# Altium project Main_Board.PrjPcb (part 32 of 44)

## Sheet GPIO_I2C.SchDoc: GPIO - EXPANDER
size A3; Organization: Altium Limited; Address1: L3, 12a Rodborough Rd; Address2: Frenchs Forest; Address3: NSW; Address4: Australia 2086
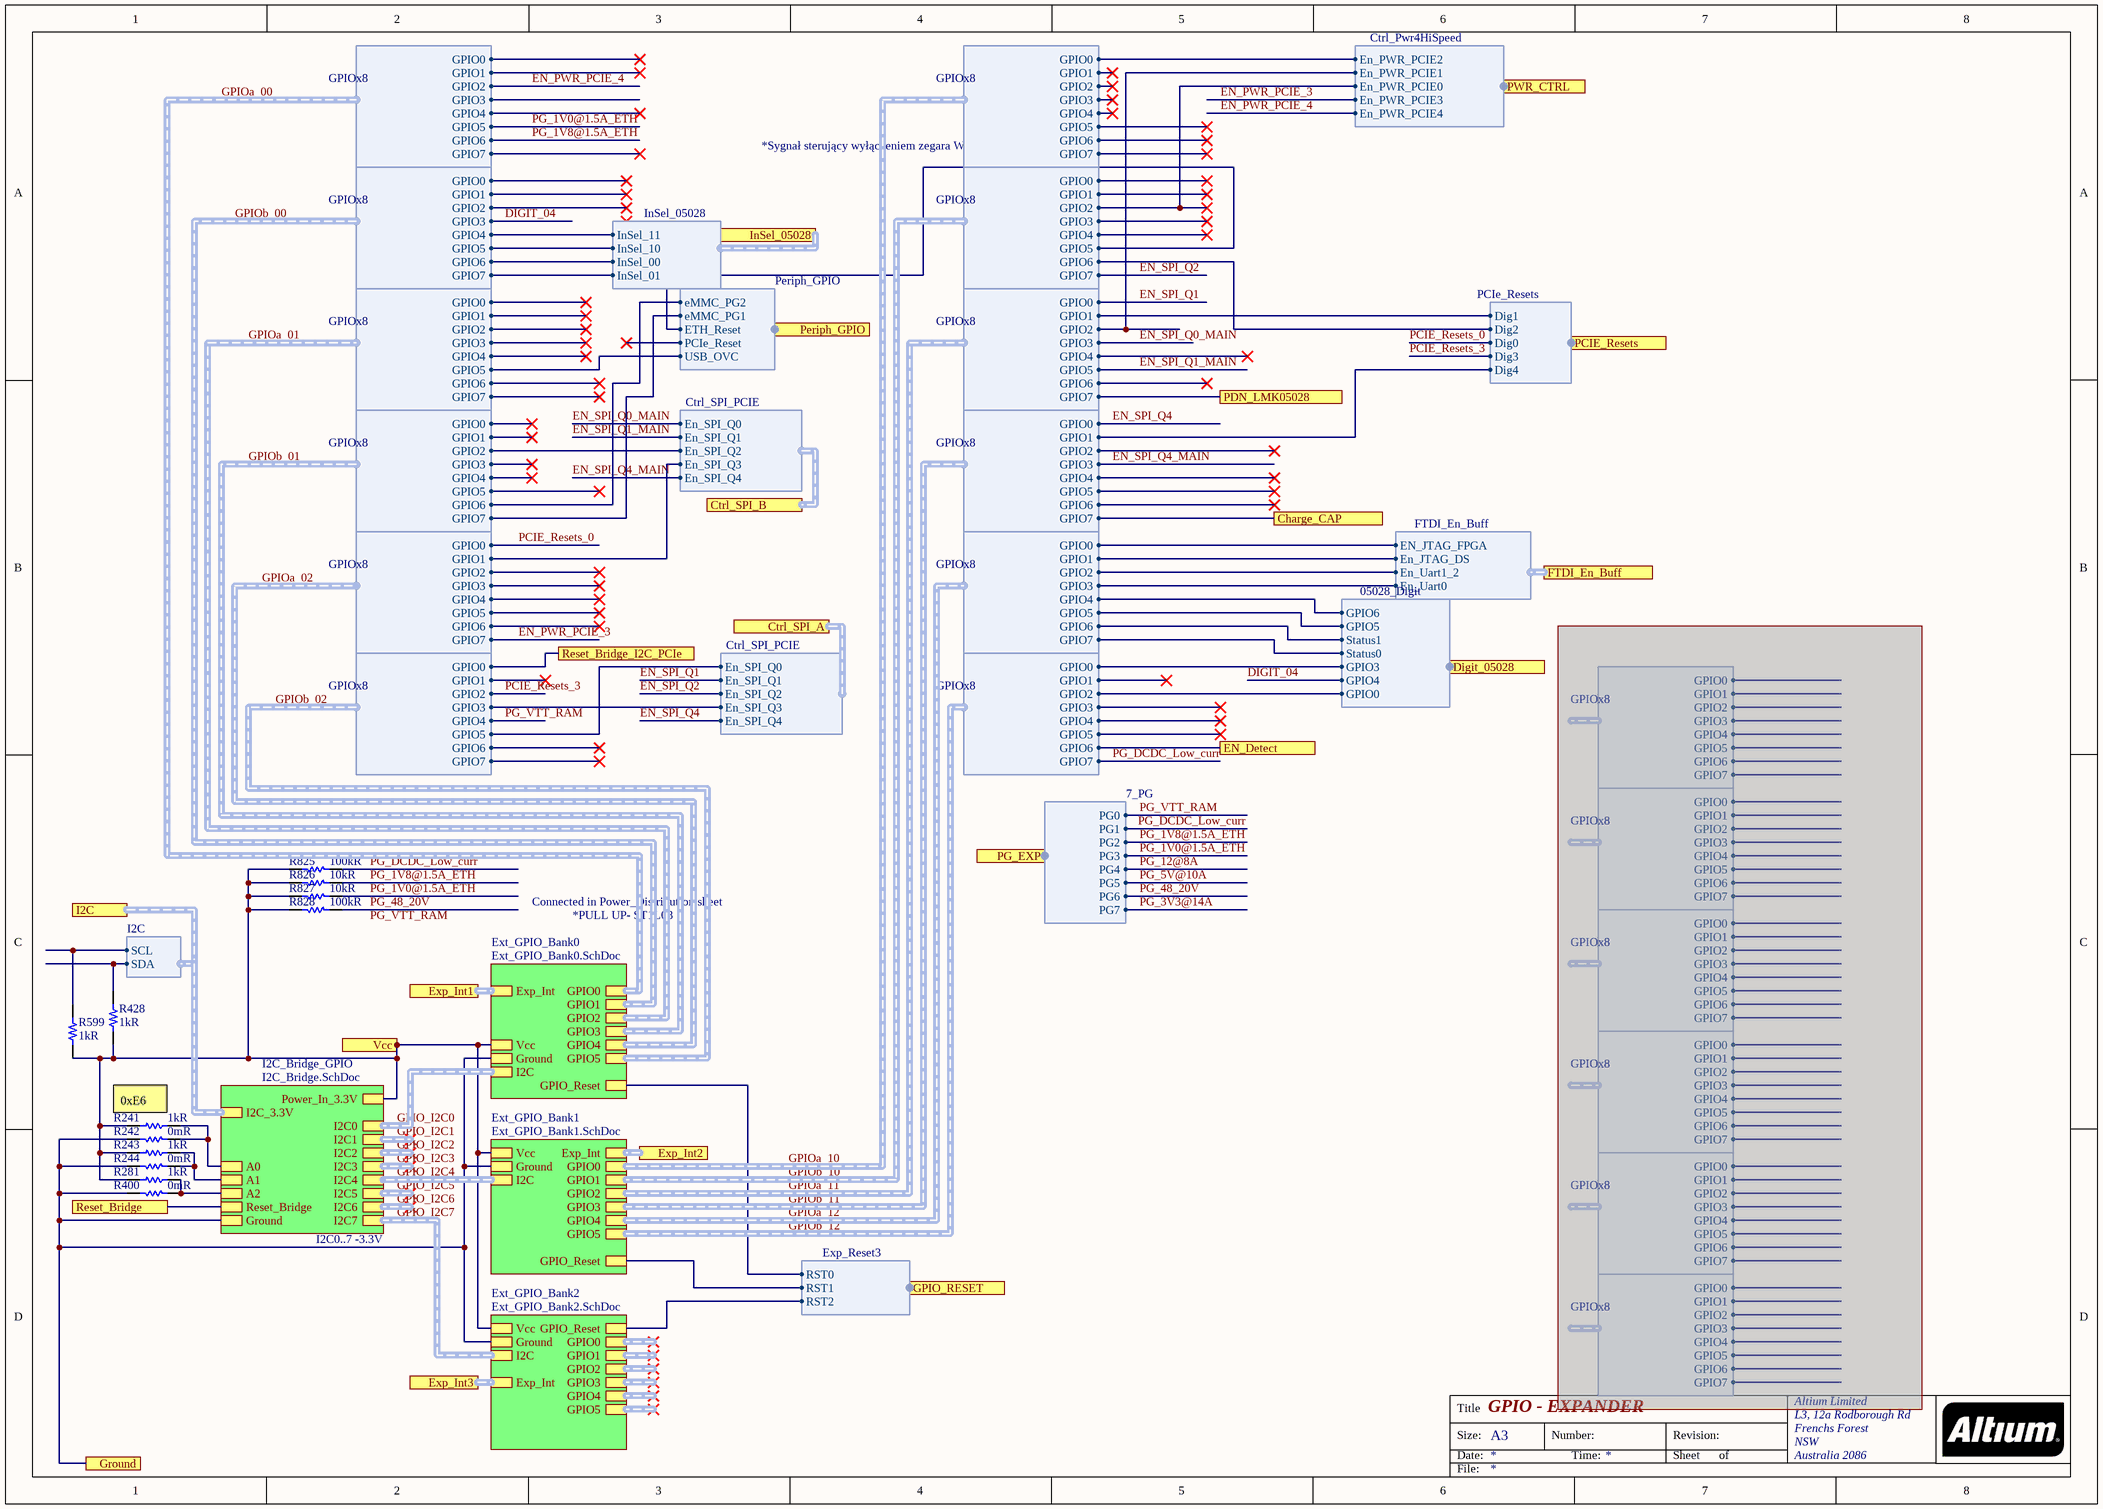
[diagram p47: GPIO_I2C.SchDoc]

### Parts
R241  1kR  [RES 0402/1005 RF KK]
R242  0mR  [RES 0402/1005 RF KK]
R243  1kR  [RES 0402/1005 RF KK]
R244  0mR  [RES 0402/1005 RF KK]
R281  1kR  [RES 0402/1005 RF KK]
R400  0mR  [RES 0402/1005 RF KK]
R428  1kR  [RES 0402/1005 RF KK]
R599  1kR  [RES 0402/1005 RF KK]
R825  100kR  [RES 0402/1005 RF KK]
R826  10kR  [RES 0402/1005 RF KK]
R827  10kR  [RES 0402/1005 RF KK]
R828  100kR  [RES 0402/1005 RF KK]

### Sub-sheets
Ext_GPIO_Bank0 = Ext_GPIO_Bank0.SchDoc: Vcc, Ground, I2C (harness I2C), GPIO5 (harness GPIOx8), GPIO4 (harness GPIOx8), GPIO3 (harness GPIOx8), GPIO2 (harness GPIOx8), GPIO1 (harness GPIOx8), GPIO0 (harness GPIOx8), GPIO_Reset, Exp_Int (harness Exp_Int)
Ext_GPIO_Bank1 = Ext_GPIO_Bank1.SchDoc: Vcc, Ground, I2C (harness I2C), GPIO5 (harness GPIOx8), GPIO4 (harness GPIOx8), GPIO3 (harness GPIOx8), GPIO2 (harness GPIOx8), GPIO1 (harness GPIOx8), GPIO0 (harness GPIOx8), GPIO_Reset, Exp_Int (harness Exp_Int)
Ext_GPIO_Bank2 = Ext_GPIO_Bank2.SchDoc: Vcc, Ground, I2C (harness I2C), GPIO5 (harness GPIOx8), GPIO4 (harness GPIOx8), GPIO3 (harness GPIOx8), GPIO2 (harness GPIOx8), GPIO1 (harness GPIOx8), GPIO0 (harness GPIOx8), GPIO_Reset, Exp_Int (harness Exp_Int)
I2C_Bridge_GPIO = I2C_Bridge.SchDoc: I2C0 (harness I2C), I2C1 (harness I2C), I2C2 (harness I2C), I2C3 (harness I2C), I2C4 (harness I2C), I2C5 (harness I2C), I2C6 (harness I2C), I2C7 (harness I2C), Ground, A2, A1, A0, I2C_3.3V (harness I2C), Reset_Bridge, Power_In_3.3V

### Ports
Charge_CAP, Ctrl_SPI_A (harness Ctrl_SPI_PCIE), Ctrl_SPI_B (harness Ctrl_SPI_PCIE), Digit_05028 (harness 05028_Digit), EN_Detect, Exp_Int1 (harness Exp_Int), Exp_Int2 (harness Exp_Int), Exp_Int3 (harness Exp_Int), FTDI_En_Buff (harness FTDI_En_Buff), GPIO_RESET (harness Exp_Reset3), Ground, I2C (harness I2C), InSel_05028 (harness InSel_05028), PCIE_Resets (harness PCIe_Resets), PDN_LMK05028, Periph_GPIO (harness Periph_GPIO), PG_EXP (harness 7_PG), PWR_CTRL (harness Ctrl_Pwr4HiSpeed), Reset_Bridge, Reset_Bridge_I2C_PCIe, Vcc

### Harnesses
Ctrl_SPI_PCIE: En_SPI_Q0, En_SPI_Q1, En_SPI_Q2, En_SPI_Q3, En_SPI_Q4
I2C: SCL, SDA
7_PG: PG0, PG1, PG2, PG3, PG4, PG5, PG6, PG7
GPIOx8: GPIO0, GPIO1, GPIO2, GPIO3, GPIO4, GPIO5, GPIO6, GPIO7
PCIe_Resets: Dig0, Dig1, Dig2, Dig3, Dig4
Ctrl_Pwr4HiSpeed: En_PWR_PCIE0, En_PWR_PCIE1, En_PWR_PCIE2, En_PWR_PCIE3, En_PWR_PCIE4
Exp_Reset3: RST0, RST1, RST2
InSel_05028: InSel_00, InSel_01, InSel_10, InSel_11
FTDI_En_Buff: EN_JTAG_FPGA, En_JTAG_DS, En_Uart1_2, En_Uart0
Periph_GPIO: eMMC_PG2, eMMC_PG1, ETH_Reset, PCIe_Reset, USB_OVC
05028_Digit: GPIO4, GPIO3, Status0, GPIO6, Status1, GPIO5, GPIO0

### Nets
B503_Ground: R242.2 R244.2 R400.2 ; port Ground, sheet I2C_Bridge_GPIO/Ground, sheet Ext_GPIO_Bank0/Ground, sheet Ext_GPIO_Bank1/Ground, sheet Ext_GPIO_Bank2/Ground
3V3_RAIL: R241.1 R243.1 R281.1 R428.2 R599.2 R825.1 R826.1 R827.1 R828.1 ; port Vcc, sheet I2C_Bridge_GPIO/Power_In_3.3V, sheet Ext_GPIO_Bank0/Vcc, sheet Ext_GPIO_Bank1/Vcc, sheet Ext_GPIO_Bank2/Vcc
Charge_CAP: port Charge_CAP, sheet Ext_GPIO_Bank1/GPIO3.GPIO7
D_05028_G3: sheet Ext_GPIO_Bank1/GPIO5.GPIO0, port Digit_05028.GPIO3
D_05028_G5: sheet Ext_GPIO_Bank1/GPIO4.GPIO5, port Digit_05028.GPIO5
D_05028_G6: sheet Ext_GPIO_Bank1/GPIO4.GPIO4, port Digit_05028.GPIO6
D_05028_S0: sheet Ext_GPIO_Bank1/GPIO4.GPIO7, port Digit_05028.Status0
D_05028_S1: sheet Ext_GPIO_Bank1/GPIO4.GPIO6, port Digit_05028.Status1
DIGIT_04: sheet Ext_GPIO_Bank0/GPIO1.GPIO3, port Digit_05028.GPIO4  [project net D_05028_G4]
eMMC_PG1: sheet Ext_GPIO_Bank0/GPIO3.GPIO7, port Periph_GPIO.eMMC_PG1
eMMC_PG2: sheet Ext_GPIO_Bank0/GPIO3.GPIO6, port Periph_GPIO.eMMC_PG2
EN_Detect: port EN_Detect, sheet Ext_GPIO_Bank1/GPIO5.GPIO6
EN_PWR_PCIE_3: sheet Ext_GPIO_Bank0/GPIO4.GPIO7, port PWR_CTRL.En_PWR_PCIE3
EN_PWR_PCIE_4: sheet Ext_GPIO_Bank0/GPIO0.GPIO2, port PWR_CTRL.En_PWR_PCIE4
En_PWRSwitch_PCIE0: sheet Ext_GPIO_Bank1/GPIO1.GPIO2, port PWR_CTRL.En_PWR_PCIE0
En_PWRSwitch_PCIE1: sheet Ext_GPIO_Bank1/GPIO2.GPIO2, port PWR_CTRL.En_PWR_PCIE1
En_PWRSwitch_PCIE2: sheet Ext_GPIO_Bank1/GPIO0.GPIO0, port PWR_CTRL.En_PWR_PCIE2
EN_SPI_Q0_MAIN: port Ctrl_SPI_B.En_SPI_Q0, sheet Ext_GPIO_Bank1/GPIO2.GPIO3
EN_SPI_Q1: port Ctrl_SPI_A.En_SPI_Q1, sheet Ext_GPIO_Bank1/GPIO2.GPIO0
EN_SPI_Q1_MAIN: port Ctrl_SPI_B.En_SPI_Q1, sheet Ext_GPIO_Bank1/GPIO2.GPIO5
EN_SPI_Q2: port Ctrl_SPI_A.En_SPI_Q2, sheet Ext_GPIO_Bank1/GPIO1.GPIO7
EN_SPI_Q4: port Ctrl_SPI_A.En_SPI_Q4, sheet Ext_GPIO_Bank1/GPIO3.GPIO0
EN_SPI_Q4_MAIN: port Ctrl_SPI_B.En_SPI_Q4, sheet Ext_GPIO_Bank1/GPIO3.GPIO3
FTDI_JTAG_ON_1: sheet Ext_GPIO_Bank1/GPIO4.GPIO0, port FTDI_En_Buff.EN_JTAG_FPGA
FTDI_JTAG_ON_2: sheet Ext_GPIO_Bank1/GPIO4.GPIO1, port FTDI_En_Buff.En_JTAG_DS
FTDI_JTAG_ON_3: sheet Ext_GPIO_Bank1/GPIO4.GPIO2, port FTDI_En_Buff.En_Uart1_2
FTDI_JTAG_ON_4: sheet Ext_GPIO_Bank1/GPIO4.GPIO3, port FTDI_En_Buff.En_Uart0
GPIO_ETH_EXPANDER: sheet Ext_GPIO_Bank1/GPIO1.GPIO5, port Periph_GPIO.ETH_Reset
GPIO_Exp_Reset0: sheet Ext_GPIO_Bank0/GPIO_Reset, port GPIO_RESET.RST0
GPIO_Exp_Reset1: sheet Ext_GPIO_Bank1/GPIO_Reset, port GPIO_RESET.RST1
GPIO_Exp_Reset2: sheet Ext_GPIO_Bank2/GPIO_Reset, port GPIO_RESET.RST2
GPIOa_01.GPIO5: sheet Ext_GPIO_Bank0/GPIO2.GPIO5, port Periph_GPIO.USB_OVC
GPIOa_02.GPIO1: port Ctrl_SPI_B.En_SPI_Q3, sheet Ext_GPIO_Bank0/GPIO4.GPIO1
GPIOa_11.GPIO1: sheet Ext_GPIO_Bank1/GPIO2.GPIO1, port PCIE_Resets.Dig1
GPIOa_11.GPIO7: port PDN_LMK05028, sheet Ext_GPIO_Bank1/GPIO2.GPIO7
GPIOb_00.GPIO4: sheet Ext_GPIO_Bank0/GPIO1.GPIO4, port InSel_05028.InSel_11
GPIOb_00.GPIO5: sheet Ext_GPIO_Bank0/GPIO1.GPIO5, port InSel_05028.InSel_10
GPIOb_00.GPIO6: sheet Ext_GPIO_Bank0/GPIO1.GPIO6, port InSel_05028.InSel_00
GPIOb_00.GPIO7: sheet Ext_GPIO_Bank0/GPIO1.GPIO7, port InSel_05028.InSel_01
GPIOb_01.GPIO2: port Ctrl_SPI_B.En_SPI_Q2, sheet Ext_GPIO_Bank0/GPIO3.GPIO2
GPIOb_02.GPIO0: port Reset_Bridge_I2C_PCIe, sheet Ext_GPIO_Bank0/GPIO5.GPIO0
GPIOb_02.GPIO3: port Ctrl_SPI_A.En_SPI_Q3, sheet Ext_GPIO_Bank0/GPIO5.GPIO3
GPIOb_02.GPIO5: port Ctrl_SPI_A.En_SPI_Q0, sheet Ext_GPIO_Bank0/GPIO5.GPIO5
GPIOb_10.GPIO6: sheet Ext_GPIO_Bank1/GPIO1.GPIO6, port PCIE_Resets.Dig2
GPIOb_11.GPIO1: sheet Ext_GPIO_Bank1/GPIO3.GPIO1, port PCIE_Resets.Dig4
GPIOb_12.GPIO2: sheet Ext_GPIO_Bank1/GPIO5.GPIO2, port Digit_05028.GPIO0
I2C1_Rail.SCL: R599.1 ; port I2C.SCL
I2C1_Rail.SDA: R428.1 ; port I2C.SDA
PCIE_Resets_0: sheet Ext_GPIO_Bank0/GPIO4.GPIO0, port PCIE_Resets.Dig0  [project net GPIOa_02.GPIO0]
PCIE_Resets_3: sheet Ext_GPIO_Bank0/GPIO5.GPIO2, port PCIE_Resets.Dig3  [project net GPIOb_02.GPIO2]
PG_1V0@1.5A_ETH: R827.2 ; port PG_EXP.PG3, sheet Ext_GPIO_Bank0/GPIO0.GPIO5  [project net GPIOa_00.GPIO5]
PG_1V8@1.5A_ETH: R826.2 ; port PG_EXP.PG2, sheet Ext_GPIO_Bank0/GPIO0.GPIO6  [project net GPIOa_00.GPIO6]
PG_48_20V: R828.2 ; port PG_EXP.PG6
PG_DCDC_Low_curr: R825.2 ; port PG_EXP.PG1, sheet Ext_GPIO_Bank1/GPIO5.GPIO7  [project net GPIOb_12.GPIO7]
PG_VTT_RAM: port PG_EXP.PG0, sheet Ext_GPIO_Bank0/GPIO5.GPIO4  [project net GPIOb_02.GPIO4]
NetR241_2: R241.2 R242.1 ; sheet I2C_Bridge_GPIO/A0
NetR243_2: R243.2 R244.1 ; sheet I2C_Bridge_GPIO/A1
NetR281_2: R281.2 R400.1 ; sheet I2C_Bridge_GPIO/A2
NetSP12_I2C_Bridge_GPIO_1: port Reset_Bridge, sheet I2C_Bridge_GPIO/Reset_Bridge

### Buses and harness runs
harness GPIO_I2C0 = sheet Ext_GPIO_Bank0/I2C = sheet I2C_Bridge_GPIO/I2C0
harness GPIO_I2C1 = sheet I2C_Bridge_GPIO/I2C1
harness GPIO_I2C2 = sheet I2C_Bridge_GPIO/I2C2
harness GPIO_I2C3 = sheet I2C_Bridge_GPIO/I2C3
harness GPIO_I2C4 = sheet Ext_GPIO_Bank1/I2C = sheet I2C_Bridge_GPIO/I2C4
harness GPIO_I2C5 = sheet I2C_Bridge_GPIO/I2C5
harness GPIO_I2C6 = sheet I2C_Bridge_GPIO/I2C6
harness GPIO_I2C7 = sheet Ext_GPIO_Bank2/I2C = sheet I2C_Bridge_GPIO/I2C7
harness GPIOa_00 = sheet Ext_GPIO_Bank0/GPIO0
harness GPIOa_01 = sheet Ext_GPIO_Bank0/GPIO2
harness GPIOa_02 = sheet Ext_GPIO_Bank0/GPIO4
harness GPIOa_10 = sheet Ext_GPIO_Bank1/GPIO0
harness GPIOa_11 = sheet Ext_GPIO_Bank1/GPIO2
harness GPIOa_12 = sheet Ext_GPIO_Bank1/GPIO4
harness GPIOb_00 = sheet Ext_GPIO_Bank0/GPIO1
harness GPIOb_01 = sheet Ext_GPIO_Bank0/GPIO3
harness GPIOb_02 = sheet Ext_GPIO_Bank0/GPIO5
harness GPIOb_10 = sheet Ext_GPIO_Bank1/GPIO1
harness GPIOb_11 = sheet Ext_GPIO_Bank1/GPIO3
harness GPIOb_12 = sheet Ext_GPIO_Bank1/GPIO5
harness port Exp_Int1 = sheet Ext_GPIO_Bank0/Exp_Int
harness port Exp_Int2 = sheet Ext_GPIO_Bank1/Exp_Int
harness port Exp_Int3 = sheet Ext_GPIO_Bank2/Exp_Int
harness port I2C = sheet I2C_Bridge_GPIO/I2C_3.3V

### Notes on the sheet
- *Sygnał sterujący wyłączeniem zegara WR
- Connected in Power_Distribution sheet
- *PULL UP- ST1L08
- (near R241) 0xE6
- I2C0..7 -3.3V
- Labels drawn without touching a wire or pin: PG_VTT_RAM
- Title
- Size:
- Date:
- A3
- Number:
- Time:
- Revision:
- Sheet
- of
- File:

### Library data of the parts
R241 R243 R281 = Resistor: PANASONIC - ERJ-2RKF1001X - SMD Chip Resistor, 0402 [1005 Metric], 1 kohm, ERJ2R Series, 50 V, Thick Film, 100 mW; Voltage Rating (DC): 50V; Temperature Coefficient: 100ppm/°C; Tolerance: 1%; Power Rating: 100mW; Supplier 1: Digi-Key; Supplier Part Number 1: P1.00KLDKR-ND; Manufacturer: Panasonic; Manufacturer Part Number: ERJ-2RKF1001X; RoHS: Yes; Category: Chip SMD Resistors; Stock 1: 1864188; Pricing 1: 1=0,10000, 10=0,04300, 100=0,01740, 1000=0,00782, 2500=0,00678, 5000=0,00561 (USD); Mount: Surface Mount; Case/Package: 0402; Number of Pins: 2; Case Code (Imperial): 0402; Case Code (Metric): 1005; Contact Plating: Tin; Min Operating Temperature: -55°C; Max Operating Temperature: 155°C; Termination: SMD/SMT; Composition: Thick Film; Number of Terminations: 2; Military Standard: Not; Features: Automotive AEC-Q200; Resistance: 1kR; Packaging: Tape and Reel; Voltage Rating: 50V; Package Quantity: 1; Max Power Dissipation: 100mW; Working Voltage: 50V; Length: 1mm; Height: 0.35mm; Depth: 0.5mm; Width: 0.5mm; Radiation Hardening: No; Lead Free: Lead Free; REACH SVHC: No SVHC; ComponentLink1URL: https://datasheet.ciiva.com/11821/0900766b80f80784-11821203.pdf?src-supplier=RSComponents; ComponentLink1Description: https://datasheet.ciiva.com/11821/0900766b80f80784-11821203.pdf?src-supplier=RSComponents; ComponentLink2URL: https://datasheet.ciiva.com/7942/aoa0000ce2-7942426.pdf?src-supplier=Element14; ComponentLink2Description: https://datasheet.ciiva.com/7942/aoa0000ce2-7942426.pdf?src-supplier=Element14; ComponentLink3URL: https://datasheet.ciiva.com/16523/aoa0000ce2-16523834.pdf?src-supplier=Avnet+Asia; ComponentLink3Description: https://datasheet.ciiva.com/16523/aoa0000ce2-16523834.pdf?src-supplier=Avnet+Asia; ComponentLink4URL: https://datasheet.ciiva.com/17215/aoa0000ce2-17215308.pdf?src-supplier=Avnet+Europe; ComponentLink4Description: https://datasheet.ciiva.com/17215/aoa0000ce2-17215308.pdf?src-supplier=Avnet+Europe; ComponentLink5URL: https://datasheet.ciiva.com/22673/1678782-22673916.pdf?src-supplier=Element14; ComponentLink5Description: https://datasheet.ciiva.com/22673/1678782-22673916.pdf?src-supplier=Element14; ComponentLink6URL: https://datasheet.ciiva.com/28532/1678782-28532109.pdf?src-supplier=Element14; ComponentLink6Description: https://datasheet.ciiva.com/28532/1678782-28532109.pdf?src-supplier=Element14; ComponentLink7URL: https://datasheet.ciiva.com/16767/70260748-16767559.pdf?src-supplier=Allied+Electronics; ComponentLink7Description: https://datasheet.ciiva.com/16767/70260748-16767559.pdf?src-supplier=Allied+Electronics; ComponentLink8URL: https://datasheet.ciiva.com/9198/aoa0000ce2-9198920.pdf?src-supplier=Avnet; ComponentLink8Description: https://datasheet.ciiva.com/9198/aoa0000ce2-9198920.pdf?src-supplier=Avnet; ComponentLink9URL: https://datasheet.ciiva.com/16771/70260748-16771979.pdf?src-supplier=Allied+Electronics; ComponentLink9Description: https://datasheet.ciiva.com/16771/70260748-16771979.pdf?src-supplier=Allied+Electronics
R242 R244 R400 = Resistor: as R665 on sheet Power_48_20V@3A; Supplier 1: Digi-Key; Supplier Part Number 1: 311-0.0JRCT-ND; Stock 1: 69822252; Pricing 1: 1=0.10000, 10=0.01200, 25=0.00920, 50=0.00680, 100=0.00510, 250=0.00388, 500=0.00308, 1000=0.00227, 5000=0.00163 (USD); RoHS: Yes; Case/Package: 0402; Contact Plating: Tin,Matte; Case Code (Metric): 1005; Case Code (Imperial): 0402; Min Operating Temperature: -55°C; Max Operating Temperature: 155°C; Resistance: 0mR; Packaging: Tape and Reel; Composition: Thick Film; Package Quantity: 1; Number of Terminations: 2; Termination: SMD/SMT; Military Standard: Not; Features: Moisture Resistant; Length: 1mm; Height: 0.016inch; Width: 0.02inch; Depth: 0.5mm; Radiation Hardening: No; REACH SVHC: Unknown; Lead Free: Lead Free; ComponentLink1URL: https://datasheet.ciiva.com/2452/pyu-rc0402-51-rohs-l-6-2452608.pdf?src-supplier=Digi-Key; ComponentLink1Description: https://datasheet.ciiva.com/2452/pyu-rc0402-51-rohs-l-6-2452608.pdf?src-supplier=Digi-Key; ComponentLink2URL: https://datasheet.ciiva.com/11808/0900766b80c66297-11808195.pdf?src-supplier=RSComponents; ComponentLink2Description: https://datasheet.ciiva.com/11808/0900766b80c66297-11808195.pdf?src-supplier=RSComponents; ComponentLink3URL: https://datasheet.ciiva.com/2452/pyu-r-int-thick-7-2452609.pdf?src-supplier=Digi-Key; ComponentLink3Description: https://datasheet.ciiva.com/2452/pyu-r-int-thick-7-2452609.pdf?src-supplier=Digi-Key; ComponentLink4URL: https://datasheet.ciiva.com/22747/1018594-22747515.pdf?src-supplier=Element14; ComponentLink4Description: https://datasheet.ciiva.com/22747/1018594-22747515.pdf?src-supplier=Element14; ComponentLink5URL: https://datasheet.ciiva.com/7983/1018594-7983535.pdf?src-supplier=Element14; ComponentLink5Description: https://datasheet.ciiva.com/7983/1018594-7983535.pdf?src-supplier=Element14; ComponentLink6URL: https://datasheet.ciiva.com/2452/pyu-r-int-thick-7-2452610.pdf?src-supplier=Digi-Key; ComponentLink6Description: https://datasheet.ciiva.com/2452/pyu-r-int-thick-7-2452610.pdf?src-supplier=Digi-Key; ComponentLink7URL: https://datasheet.ciiva.com/8896/pyu-rc0402-51-rohs-l-6-8896201.pdf?src-supplier=Avnet; ComponentLink7Description: https://datasheet.ciiva.com/8896/pyu-rc0402-51-rohs-l-6-8896201.pdf?src-supplier=Avnet; ComponentLink8URL: https://datasheet.ciiva.com/28386/pyu-rc0402-51-rohs-l-6-28386633.pdf?src-supplier=Avnet+Europe; ComponentLink8Description: https://datasheet.ciiva.com/28386/pyu-rc0402-51-rohs-l-6-28386633.pdf?src-supplier=Avnet+Europe; ComponentLink9URL: https://datasheet.ciiva.com/15189/getdatasheetpartid-326379-15189533.pdf?src-supplier=Verical; ComponentLink9Description: https://datasheet.ciiva.com/15189/getdatasheetpartid-326379-15189533.pdf?src-supplier=Verical
R428 R599 = Resistor: Manufacturer: Panasonic; Manufacturer Part Number: ERJ-2RKF1001X; Tolerance: 1%; Power Rating: 100mW; Temperature Coefficient: 100ppm/°C; Voltage Rating: 50V; Supplier 1: Digi-Key; Supplier Part Number 1: P1.00KLCT-ND; Stock 1: 6683975; Pricing 1: 1 = 0,10000, 10 = 0,05200, 100 = 0,02130, 1000 = 0,00958, 2500 = 0,00832, 5000 = 0,00687 (USD); RoHS: Yes; Mount: Surface Mount; Case/Package: 0402; Number of Pins: 2; Case Code (Imperial): 0402; Case Code (Metric): 1005; Contact Plating: Tin; Min Operating Temperature: -55°C; Max Operating Temperature: 155°C; Resistance: 1kR; Packaging: Tape and Reel; Composition: Thick Film; Termination: SMD/SMT; Package Quantity: 1; Military Standard: Not; Number of Terminations: 2; Max Power Dissipation: 100mW; Voltage Rating (DC): 50V; Features: Automotive AEC-Q200; Working Voltage: 50V; Length: 1mm; Height: 0.35mm; Width: 0.5mm; Depth: 0.5mm; Radiation Hardening: No; Lead Free: Lead Free; REACH SVHC: No SVHC; ComponentLink1URL: https://datasheet.ciiva.com/11821/0900766b80f80784-11821203.pdf?src-supplier=RSComponents; ComponentLink1Description: https://datasheet.ciiva.com/11821/0900766b80f80784-11821203.pdf?src-supplier=RSComponents; ComponentLink2URL: https://datasheet.ciiva.com/16767/70260748-16767559.pdf?src-supplier=Allied+Electronics; ComponentLink2Description: https://datasheet.ciiva.com/16767/70260748-16767559.pdf?src-supplier=Allied+Electronics; ComponentLink3URL: https://datasheet.ciiva.com/9198/aoa0000ce2-9198920.pdf?src-supplier=Avnet; ComponentLink3Description: https://datasheet.ciiva.com/9198/aoa0000ce2-9198920.pdf?src-supplier=Avnet; ComponentLink4URL: https://datasheet.ciiva.com/7942/aoa0000ce2-7942426.pdf?src-supplier=Element14; ComponentLink4Description: https://datasheet.ciiva.com/7942/aoa0000ce2-7942426.pdf?src-supplier=Element14; ComponentLink5URL: https://datasheet.ciiva.com/16771/70260748-16771979.pdf?src-supplier=Allied+Electronics; ComponentLink5Description: https://datasheet.ciiva.com/16771/70260748-16771979.pdf?src-supplier=Allied+Electronics; ComponentLink6URL: https://datasheet.ciiva.com/17215/aoa0000ce2-17215308.pdf?src-supplier=Avnet+Europe; ComponentLink6Description: https://datasheet.ciiva.com/17215/aoa0000ce2-17215308.pdf?src-supplier=Avnet+Europe; ComponentLink7URL: https://datasheet.ciiva.com/28532/1678782-28532109.pdf?src-supplier=Element14; ComponentLink7Description: https://datasheet.ciiva.com/28532/1678782-28532109.pdf?src-supplier=Element14; ComponentLink8URL: https://datasheet.ciiva.com/16523/aoa0000ce2-16523834.pdf?src-supplier=Avnet+Asia; ComponentLink8Description: https://datasheet.ciiva.com/16523/aoa0000ce2-16523834.pdf?src-supplier=Avnet+Asia; ComponentLink9URL: https://datasheet.ciiva.com/22673/1678782-22673916.pdf?src-supplier=Element14; ComponentLink9Description: https://datasheet.ciiva.com/22673/1678782-22673916.pdf?src-supplier=Element14
R825 R828 = Resistor: as R646 on sheet ADP1741_3V3_0V85; Supplier 1: Digi-Key; Supplier Part Number 1: P100KDECT-ND; Stock 1: 54338; Pricing 1: 1=0.22000, 10=0.18800, 100=0.07350, 1000=0.03077, 2500=0.02820, 5000=0.02564 (USD); RoHS: Yes; Mount: Surface Mount; Case/Package: 0402; Case Code (Imperial): 0402; Case Code (Metric): 1005; Contact Plating: Tin; Min Operating Temperature: -55°C; Max Operating Temperature: 155°C; Resistance: 100kR; Packaging: Tape and Reel; Package Quantity: 10000; Composition: Metal Film,Thin Film; Number of Terminations: 2; Military Standard: Not; Termination: SMD/SMT; Max Power Dissipation: 63mW; Voltage Rating (DC): 25V; Length: 1mm; Height: 0.016inch; Width: 0.5mm; Depth: 0.5mm; Radiation Hardening: No; REACH SVHC: No SVHC; Lead Free: Lead Free; ComponentLink1URL: https://datasheet.ciiva.com/24028/aoa0000ce26-197354-24028150.pdf?src-supplier=Mouser; ComponentLink1Description: https://datasheet.ciiva.com/24028/aoa0000ce26-197354-24028150.pdf?src-supplier=Mouser; ComponentLink2URL: https://datasheet.ciiva.com/43470/1776116-43470438.pdf?src-supplier=Farnell; ComponentLink2Description: https://datasheet.ciiva.com/43470/1776116-43470438.pdf?src-supplier=Farnell; ComponentLink3URL: https://datasheet.ciiva.com/7830/1776116-7830920.pdf?src-supplier=Element14; ComponentLink3Description: https://datasheet.ciiva.com/7830/1776116-7830920.pdf?src-supplier=Element14; ComponentLink4URL: https://datasheet.ciiva.com/46378/1776116-46378234.pdf?src-supplier=Element14; ComponentLink4Description: https://datasheet.ciiva.com/46378/1776116-46378234.pdf?src-supplier=Element14; ComponentLink5URL: https://datasheet.ciiva.com/16780/70068849-16780139.pdf?src-supplier=Allied+Electronics; ComponentLink5Description: https://datasheet.ciiva.com/16780/70068849-16780139.pdf?src-supplier=Allied+Electronics; ComponentLink6URL: https://datasheet.ciiva.com/9117/aoa0000ce26-9117229.pdf?src-supplier=Avnet; ComponentLink6Description: https://datasheet.ciiva.com/9117/aoa0000ce26-9117229.pdf?src-supplier=Avnet; ComponentLink7URL: https://datasheet.ciiva.com/16511/aoa0000ce26-16511566.pdf?src-supplier=Avnet+Asia; ComponentLink7Description: https://datasheet.ciiva.com/16511/aoa0000ce26-16511566.pdf?src-supplier=Avnet+Asia; ComponentLink8URL: https://datasheet.ciiva.com/30225/54aoa0000ce26-30225311.pdf?src-supplier=Onlinecomponents.com; ComponentLink8Description: https://datasheet.ciiva.com/30225/54aoa0000ce26-30225311.pdf?src-supplier=Onlinecomponents.com
R826 R827 = Resistor: as R916 on sheet Power_LED; Supplier 1: Digi-Key; Supplier Part Number 1: 311-10.0KLRCT-ND; Stock 1: 71214322; Pricing 1: 1=0,10000, 10=0,01500, 100=0,00600, 1000=0,00270, 2500=0,00235, 5000=0,00194 (USD); RoHS: Yes; Case/Package: 0402; Number of Pins: 2; Case Code (Imperial): 0402; Case Code (Metric): 1005; Min Operating Temperature: -55°C; Max Operating Temperature: 155°C; Resistance: 10kR; Packaging: Tape and Reel; Composition: Thick Film; Voltage Rating (DC): 50V; Termination: SMD/SMT; Military Standard: Not; Working Voltage: 50V; Number of Terminations: 2; Length: 1mm; Height: 0.32mm; Width: 0.5mm; Depth: 0.5mm; Lead Pitch: 0.2mm; REACH SVHC: No SVHC; Lead Free: Lead Free; ComponentLink1URL: https://datasheet.ciiva.com/7660/38568-7660787.pdf?src-supplier=Element14; ComponentLink1Description: https://datasheet.ciiva.com/7660/38568-7660787.pdf?src-supplier=Element14; ComponentLink2URL: https://datasheet.ciiva.com/7849/1784430-7849813.pdf?src-supplier=Element14; ComponentLink2Description: https://datasheet.ciiva.com/7849/1784430-7849813.pdf?src-supplier=Element14; ComponentLink3URL: https://datasheet.ciiva.com/7849/1686128-7849814.pdf?src-supplier=Element14; ComponentLink3Description: https://datasheet.ciiva.com/7849/1686128-7849814.pdf?src-supplier=Element14; ComponentLink4URL: https://datasheet.ciiva.com/7849/1784430-7849815.pdf?src-supplier=Element14; ComponentLink4Description: https://datasheet.ciiva.com/7849/1784430-7849815.pdf?src-supplier=Element14; ComponentLink5URL: https://datasheet.ciiva.com/22747/1018594-22747512.pdf?src-supplier=Element14; ComponentLink5Description: https://datasheet.ciiva.com/22747/1018594-22747512.pdf?src-supplier=Element14; ComponentLink6URL: https://datasheet.ciiva.com/12667/pyu-rc0402-51-rohs-l-6-r-12667067.pdf?src-supplier=Mouser; ComponentLink6Description: https://datasheet.ciiva.com/12667/pyu-rc0402-51-rohs-l-6-r-12667067.pdf?src-supplier=Mouser; ComponentLink7URL: https://datasheet.ciiva.com/7983/1018594-7983486.pdf?src-supplier=Element14; ComponentLink7Description: https://datasheet.ciiva.com/7983/1018594-7983486.pdf?src-supplier=Element14

## Sheet Ext_GPIO_Bank0.SchDoc
size A3
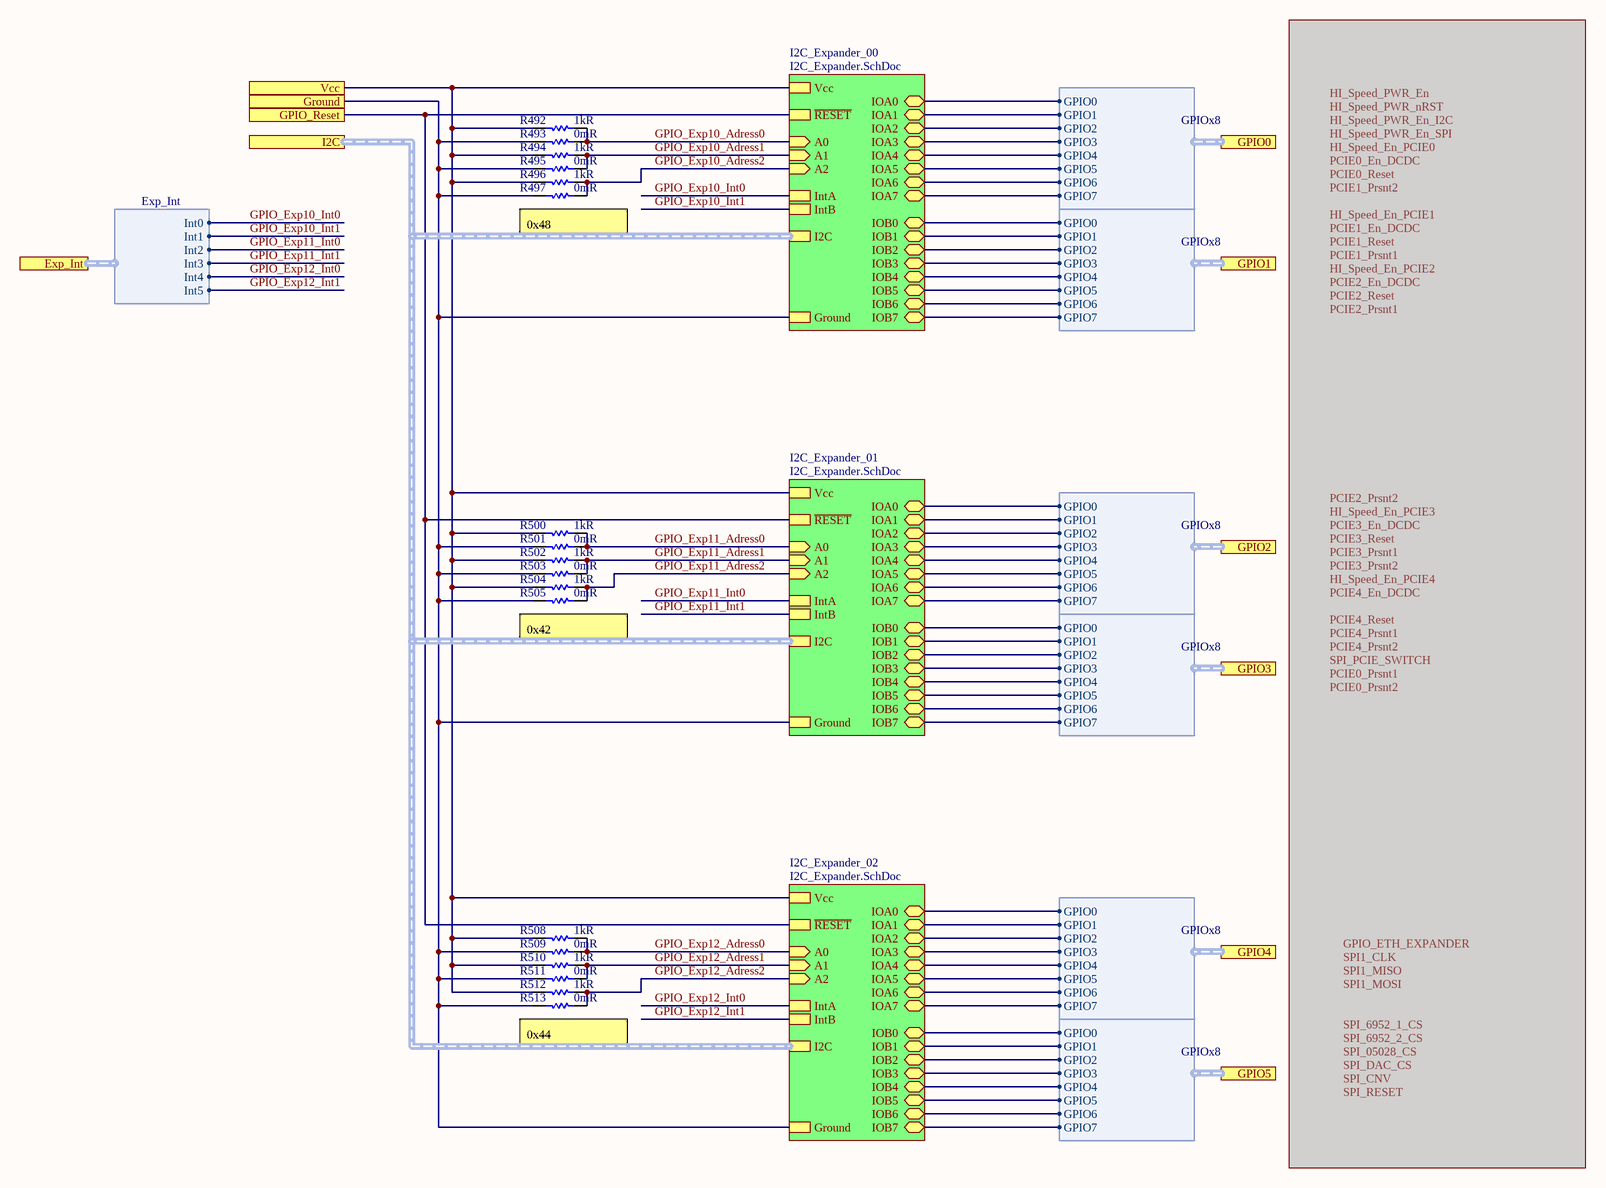
[diagram p48: Ext_GPIO_Bank0.SchDoc]

### Parts
R492  1kR  [RES 0402/1005 RF KK]
R493  0mR  [RES 0402/1005 RF KK]
R494  1kR  [RES 0402/1005 RF KK]
R495  0mR  [RES 0402/1005 RF KK]
R496  1kR  [RES 0402/1005 RF KK]
R497  0mR  [RES 0402/1005 RF KK]
R500  1kR  [RES 0402/1005 RF KK]
R501  0mR  [RES 0402/1005 RF KK]
R502  1kR  [RES 0402/1005 RF KK]
R503  0mR  [RES 0402/1005 RF KK]
R504  1kR  [RES 0402/1005 RF KK]
R505  0mR  [RES 0402/1005 RF KK]
R508  1kR  [RES 0402/1005 RF KK]
R509  0mR  [RES 0402/1005 RF KK]
R510  1kR  [RES 0402/1005 RF KK]
R511  0mR  [RES 0402/1005 RF KK]
R512  1kR  [RES 0402/1005 RF KK]
R513  0mR  [RES 0402/1005 RF KK]

### Sub-sheets
I2C_Expander_00 = I2C_Expander.SchDoc: IOA7 (bidir), IOA3 (bidir), IOA6 (bidir), IOA1 (bidir), IOA0 (bidir), IOA5 (bidir), IOB1 (bidir), IOB2 (bidir), IOB5 (bidir), IOB6 (bidir), IOB7 (bidir), IntA, IntB, Ground, IOB4 (bidir), IOB3 (bidir), IOA2 (bidir), IOA4 (bidir), IOB0 (bidir), Vcc, ~{RESET}, I2C (harness I2C), A2 (in), A1 (in), A0 (in)
I2C_Expander_01 = I2C_Expander.SchDoc: IOA7 (bidir), IOA3 (bidir), IOA6 (bidir), IOA1 (bidir), IOA0 (bidir), IOA5 (bidir), IOB1 (bidir), IOB2 (bidir), IOB5 (bidir), IOB6 (bidir), IOB7 (bidir), IntA, IntB, Ground, IOB4 (bidir), IOB3 (bidir), IOA2 (bidir), IOA4 (bidir), IOB0 (bidir), Vcc, ~{RESET}, I2C (harness I2C), A2 (in), A1 (in), A0 (in)
I2C_Expander_02 = I2C_Expander.SchDoc: IOA7 (bidir), IOA3 (bidir), IOA6 (bidir), IOA1 (bidir), IOA0 (bidir), IOA5 (bidir), IOB1 (bidir), IOB2 (bidir), IOB5 (bidir), IOB6 (bidir), IOB7 (bidir), IntA, IntB, Ground, IOB4 (bidir), IOB3 (bidir), IOA2 (bidir), IOA4 (bidir), IOB0 (bidir), Vcc, ~{RESET}, I2C (harness I2C), A2 (in), A1 (in), A0 (in)

### Ports
Exp_Int (harness Exp_Int), GPIO0 (harness GPIOx8), GPIO1 (harness GPIOx8), GPIO2 (harness GPIOx8), GPIO3 (harness GPIOx8), GPIO4 (harness GPIOx8), GPIO5 (harness GPIOx8), GPIO_Reset, Ground, I2C (harness I2C), Vcc

### Harnesses
GPIOx8: GPIO0, GPIO1, GPIO2, GPIO3, GPIO4, GPIO5, GPIO6, GPIO7
Exp_Int: Int0, Int1, Int2, Int3, Int4, Int5

### Nets
B503_Ground: R493.2 R495.2 R497.2 R501.2 R503.2 R505.2 R509.2 R511.2 R513.2 ; port Ground, sheet I2C_Expander_00/Ground, sheet I2C_Expander_01/Ground, sheet I2C_Expander_02/Ground
3V3_RAIL: R492.1 R494.1 R496.1 R500.1 R502.1 R504.1 R508.1 R510.1 R512.1 ; port Vcc, sheet I2C_Expander_00/Vcc, sheet I2C_Expander_01/Vcc, sheet I2C_Expander_02/Vcc
D_05028_G4: sheet I2C_Expander_00/IOB3, port GPIO1.GPIO3
eMMC_PG1: sheet I2C_Expander_01/IOB7, port GPIO3.GPIO7
eMMC_PG2: sheet I2C_Expander_01/IOB6, port GPIO3.GPIO6
EN_PWR_PCIE_3: sheet I2C_Expander_02/IOA7, port GPIO4.GPIO7
EN_PWR_PCIE_4: sheet I2C_Expander_00/IOA2, port GPIO0.GPIO2
GPIO_Exp10_Adress0: R492.2 R493.1 ; sheet I2C_Expander_00/A0
GPIO_Exp10_Adress1: R494.2 R495.1 ; sheet I2C_Expander_00/A1
GPIO_Exp10_Adress2: R496.2 R497.1 ; sheet I2C_Expander_00/A2
GPIO_Exp10_Int0: sheet I2C_Expander_00/IntA, port Exp_Int.Int0
GPIO_Exp10_Int1: sheet I2C_Expander_00/IntB, port Exp_Int.Int1
GPIO_Exp11_Adress0: R500.2 R501.1 ; sheet I2C_Expander_01/A0
GPIO_Exp11_Adress1: R502.2 R503.1 ; sheet I2C_Expander_01/A1
GPIO_Exp11_Adress2: R504.2 R505.1 ; sheet I2C_Expander_01/A2
GPIO_Exp11_Int0: sheet I2C_Expander_01/IntA, port Exp_Int.Int2
GPIO_Exp11_Int1: sheet I2C_Expander_01/IntB, port Exp_Int.Int3
GPIO_Exp12_Adress0: R508.2 R509.1 ; sheet I2C_Expander_02/A0
GPIO_Exp12_Adress1: R510.2 R511.1 ; sheet I2C_Expander_02/A1
GPIO_Exp12_Adress2: R512.2 R513.1 ; sheet I2C_Expander_02/A2
GPIO_Exp12_Int0: sheet I2C_Expander_02/IntA, port Exp_Int.Int4
GPIO_Exp12_Int1: sheet I2C_Expander_02/IntB, port Exp_Int.Int5
GPIO_Exp_Reset0: port GPIO_Reset, sheet I2C_Expander_00/~{RESET}, sheet I2C_Expander_01/~{RESET}, sheet I2C_Expander_02/~{RESET}
GPIOa_00.GPIO0: sheet I2C_Expander_00/IOA0, port GPIO0.GPIO0
GPIOa_00.GPIO1: sheet I2C_Expander_00/IOA1, port GPIO0.GPIO1
GPIOa_00.GPIO3: sheet I2C_Expander_00/IOA3, port GPIO0.GPIO3
GPIOa_00.GPIO4: sheet I2C_Expander_00/IOA4, port GPIO0.GPIO4
GPIOa_00.GPIO5: sheet I2C_Expander_00/IOA5, port GPIO0.GPIO5
GPIOa_00.GPIO6: sheet I2C_Expander_00/IOA6, port GPIO0.GPIO6
GPIOa_00.GPIO7: sheet I2C_Expander_00/IOA7, port GPIO0.GPIO7
GPIOa_01.GPIO0: sheet I2C_Expander_01/IOA0, port GPIO2.GPIO0
GPIOa_01.GPIO1: sheet I2C_Expander_01/IOA1, port GPIO2.GPIO1
GPIOa_01.GPIO2: sheet I2C_Expander_01/IOA2, port GPIO2.GPIO2
GPIOa_01.GPIO3: sheet I2C_Expander_01/IOA3, port GPIO2.GPIO3
GPIOa_01.GPIO4: sheet I2C_Expander_01/IOA4, port GPIO2.GPIO4
GPIOa_01.GPIO5: sheet I2C_Expander_01/IOA5, port GPIO2.GPIO5
GPIOa_01.GPIO6: sheet I2C_Expander_01/IOA6, port GPIO2.GPIO6
GPIOa_01.GPIO7: sheet I2C_Expander_01/IOA7, port GPIO2.GPIO7
GPIOa_02.GPIO0: sheet I2C_Expander_02/IOA0, port GPIO4.GPIO0
GPIOa_02.GPIO1: sheet I2C_Expander_02/IOA1, port GPIO4.GPIO1
GPIOa_02.GPIO2: sheet I2C_Expander_02/IOA2, port GPIO4.GPIO2
GPIOa_02.GPIO3: sheet I2C_Expander_02/IOA3, port GPIO4.GPIO3
GPIOa_02.GPIO4: sheet I2C_Expander_02/IOA4, port GPIO4.GPIO4
GPIOa_02.GPIO5: sheet I2C_Expander_02/IOA5, port GPIO4.GPIO5
GPIOa_02.GPIO6: sheet I2C_Expander_02/IOA6, port GPIO4.GPIO6
GPIOb_00.GPIO0: sheet I2C_Expander_00/IOB0, port GPIO1.GPIO0
GPIOb_00.GPIO1: sheet I2C_Expander_00/IOB1, port GPIO1.GPIO1
GPIOb_00.GPIO2: sheet I2C_Expander_00/IOB2, port GPIO1.GPIO2
GPIOb_00.GPIO4: sheet I2C_Expander_00/IOB4, port GPIO1.GPIO4
GPIOb_00.GPIO5: sheet I2C_Expander_00/IOB5, port GPIO1.GPIO5
GPIOb_00.GPIO6: sheet I2C_Expander_00/IOB6, port GPIO1.GPIO6
GPIOb_00.GPIO7: sheet I2C_Expander_00/IOB7, port GPIO1.GPIO7
GPIOb_01.GPIO0: sheet I2C_Expander_01/IOB0, port GPIO3.GPIO0
GPIOb_01.GPIO1: sheet I2C_Expander_01/IOB1, port GPIO3.GPIO1
GPIOb_01.GPIO2: sheet I2C_Expander_01/IOB2, port GPIO3.GPIO2
GPIOb_01.GPIO3: sheet I2C_Expander_01/IOB3, port GPIO3.GPIO3
GPIOb_01.GPIO4: sheet I2C_Expander_01/IOB4, port GPIO3.GPIO4
GPIOb_01.GPIO5: sheet I2C_Expander_01/IOB5, port GPIO3.GPIO5
GPIOb_02.GPIO0: sheet I2C_Expander_02/IOB0, port GPIO5.GPIO0
GPIOb_02.GPIO1: sheet I2C_Expander_02/IOB1, port GPIO5.GPIO1
GPIOb_02.GPIO2: sheet I2C_Expander_02/IOB2, port GPIO5.GPIO2
GPIOb_02.GPIO3: sheet I2C_Expander_02/IOB3, port GPIO5.GPIO3
GPIOb_02.GPIO4: sheet I2C_Expander_02/IOB4, port GPIO5.GPIO4
GPIOb_02.GPIO5: sheet I2C_Expander_02/IOB5, port GPIO5.GPIO5
GPIOb_02.GPIO6: sheet I2C_Expander_02/IOB6, port GPIO5.GPIO6
GPIOb_02.GPIO7: sheet I2C_Expander_02/IOB7, port GPIO5.GPIO7

### Buses and harness runs
harness port I2C = sheet I2C_Expander_00/I2C = sheet I2C_Expander_01/I2C = sheet I2C_Expander_02/I2C

### Notes on the sheet
- (near R497) 0x48
- (near R505) 0x42
- (near R513) 0x44
- Title
- Size:
- Date:
- A3
- Number:
- Time:
- Revision:
- Sheet
- of
- File:

### Library data of the parts
R492 R494 R496 R500 R502 R504 R508 R510 R512 = Resistor: PANASONIC - ERJ-2RKF1001X - SMD Chip Resistor, 0402 [1005 Metric], 1 kohm, ERJ2R Series, 50 V, Thick Film, 100 mW; Temperature Coefficient: 100ppm/°C; Tolerance: 1%; Voltage Rating (DC): 50V; Power Rating: 100mW; Supplier 1: Digi-Key; Supplier Part Number 1: P1.00KLDKR-ND; Manufacturer: Panasonic; Manufacturer Part Number: ERJ-2RKF1001X; RoHS: Yes; Category: Chip SMD Resistors; Stock 1: 1864188; Pricing 1: 1=0,10000, 10=0,04300, 100=0,01740, 1000=0,00782, 2500=0,00678, 5000=0,00561 (USD); Mount: Surface Mount; Case/Package: 0402; Number of Pins: 2; Contact Plating: Tin; Case Code (Imperial): 0402; Case Code (Metric): 1005; Min Operating Temperature: -55°C; Max Operating Temperature: 155°C; Composition: Thick Film; Resistance: 1kR; Termination: SMD/SMT; Number of Terminations: 2; Military Standard: Not; Features: Automotive AEC-Q200; Packaging: Tape and Reel; Voltage Rating: 50V; Package Quantity: 1; Max Power Dissipation: 100mW; Working Voltage: 50V; Length: 1mm; Height: 0.35mm; Depth: 0.5mm; Width: 0.5mm; Radiation Hardening: No; Lead Free: Lead Free; REACH SVHC: No SVHC; ComponentLink1URL: https://datasheet.ciiva.com/11821/0900766b80f80784-11821203.pdf?src-supplier=RSComponents; ComponentLink1Description: https://datasheet.ciiva.com/11821/0900766b80f80784-11821203.pdf?src-supplier=RSComponents; ComponentLink2URL: https://datasheet.ciiva.com/7942/aoa0000ce2-7942426.pdf?src-supplier=Element14; ComponentLink2Description: https://datasheet.ciiva.com/7942/aoa0000ce2-7942426.pdf?src-supplier=Element14; ComponentLink3URL: https://datasheet.ciiva.com/16523/aoa0000ce2-16523834.pdf?src-supplier=Avnet+Asia; ComponentLink3Description: https://datasheet.ciiva.com/16523/aoa0000ce2-16523834.pdf?src-supplier=Avnet+Asia; ComponentLink4URL: https://datasheet.ciiva.com/17215/aoa0000ce2-17215308.pdf?src-supplier=Avnet+Europe; ComponentLink4Description: https://datasheet.ciiva.com/17215/aoa0000ce2-17215308.pdf?src-supplier=Avnet+Europe; ComponentLink5URL: https://datasheet.ciiva.com/22673/1678782-22673916.pdf?src-supplier=Element14; ComponentLink5Description: https://datasheet.ciiva.com/22673/1678782-22673916.pdf?src-supplier=Element14; ComponentLink6URL: https://datasheet.ciiva.com/28532/1678782-28532109.pdf?src-supplier=Element14; ComponentLink6Description: https://datasheet.ciiva.com/28532/1678782-28532109.pdf?src-supplier=Element14; ComponentLink7URL: https://datasheet.ciiva.com/16767/70260748-16767559.pdf?src-supplier=Allied+Electronics; ComponentLink7Description: https://datasheet.ciiva.com/16767/70260748-16767559.pdf?src-supplier=Allied+Electronics; ComponentLink8URL: https://datasheet.ciiva.com/9198/aoa0000ce2-9198920.pdf?src-supplier=Avnet; ComponentLink8Description: https://datasheet.ciiva.com/9198/aoa0000ce2-9198920.pdf?src-supplier=Avnet; ComponentLink9URL: https://datasheet.ciiva.com/16771/70260748-16771979.pdf?src-supplier=Allied+Electronics; ComponentLink9Description: https://datasheet.ciiva.com/16771/70260748-16771979.pdf?src-supplier=Allied+Electronics
R493 R495 R497 R501 R503 R505 R509 R511 R513 = Resistor: as R665 on sheet Power_48_20V@3A; Supplier 1: Digi-Key; Supplier Part Number 1: 311-0.0JRCT-ND; Stock 1: 69822252; Pricing 1: 1=0.10000, 10=0.01200, 25=0.00920, 50=0.00680, 100=0.00510, 250=0.00388, 500=0.00308, 1000=0.00227, 5000=0.00163 (USD); RoHS: Yes; Case/Package: 0402; Contact Plating: Tin,Matte; Case Code (Metric): 1005; Case Code (Imperial): 0402; Min Operating Temperature: -55°C; Max Operating Temperature: 155°C; Resistance: 0mR; Packaging: Tape and Reel; Composition: Thick Film; Package Quantity: 1; Number of Terminations: 2; Termination: SMD/SMT; Military Standard: Not; Features: Moisture Resistant; Length: 1mm; Height: 0.016inch; Width: 0.02inch; Depth: 0.5mm; Radiation Hardening: No; REACH SVHC: Unknown; Lead Free: Lead Free; ComponentLink1URL: https://datasheet.ciiva.com/2452/pyu-rc0402-51-rohs-l-6-2452608.pdf?src-supplier=Digi-Key; ComponentLink1Description: https://datasheet.ciiva.com/2452/pyu-rc0402-51-rohs-l-6-2452608.pdf?src-supplier=Digi-Key; ComponentLink2URL: https://datasheet.ciiva.com/11808/0900766b80c66297-11808195.pdf?src-supplier=RSComponents; ComponentLink2Description: https://datasheet.ciiva.com/11808/0900766b80c66297-11808195.pdf?src-supplier=RSComponents; ComponentLink3URL: https://datasheet.ciiva.com/2452/pyu-r-int-thick-7-2452609.pdf?src-supplier=Digi-Key; ComponentLink3Description: https://datasheet.ciiva.com/2452/pyu-r-int-thick-7-2452609.pdf?src-supplier=Digi-Key; ComponentLink4URL: https://datasheet.ciiva.com/22747/1018594-22747515.pdf?src-supplier=Element14; ComponentLink4Description: https://datasheet.ciiva.com/22747/1018594-22747515.pdf?src-supplier=Element14; ComponentLink5URL: https://datasheet.ciiva.com/7983/1018594-7983535.pdf?src-supplier=Element14; ComponentLink5Description: https://datasheet.ciiva.com/7983/1018594-7983535.pdf?src-supplier=Element14; ComponentLink6URL: https://datasheet.ciiva.com/2452/pyu-r-int-thick-7-2452610.pdf?src-supplier=Digi-Key; ComponentLink6Description: https://datasheet.ciiva.com/2452/pyu-r-int-thick-7-2452610.pdf?src-supplier=Digi-Key; ComponentLink7URL: https://datasheet.ciiva.com/8896/pyu-rc0402-51-rohs-l-6-8896201.pdf?src-supplier=Avnet; ComponentLink7Description: https://datasheet.ciiva.com/8896/pyu-rc0402-51-rohs-l-6-8896201.pdf?src-supplier=Avnet; ComponentLink8URL: https://datasheet.ciiva.com/28386/pyu-rc0402-51-rohs-l-6-28386633.pdf?src-supplier=Avnet+Europe; ComponentLink8Description: https://datasheet.ciiva.com/28386/pyu-rc0402-51-rohs-l-6-28386633.pdf?src-supplier=Avnet+Europe; ComponentLink9URL: https://datasheet.ciiva.com/15189/getdatasheetpartid-326379-15189533.pdf?src-supplier=Verical; ComponentLink9Description: https://datasheet.ciiva.com/15189/getdatasheetpartid-326379-15189533.pdf?src-supplier=Verical

## Sheet Ext_GPIO_Bank1.SchDoc
size A3
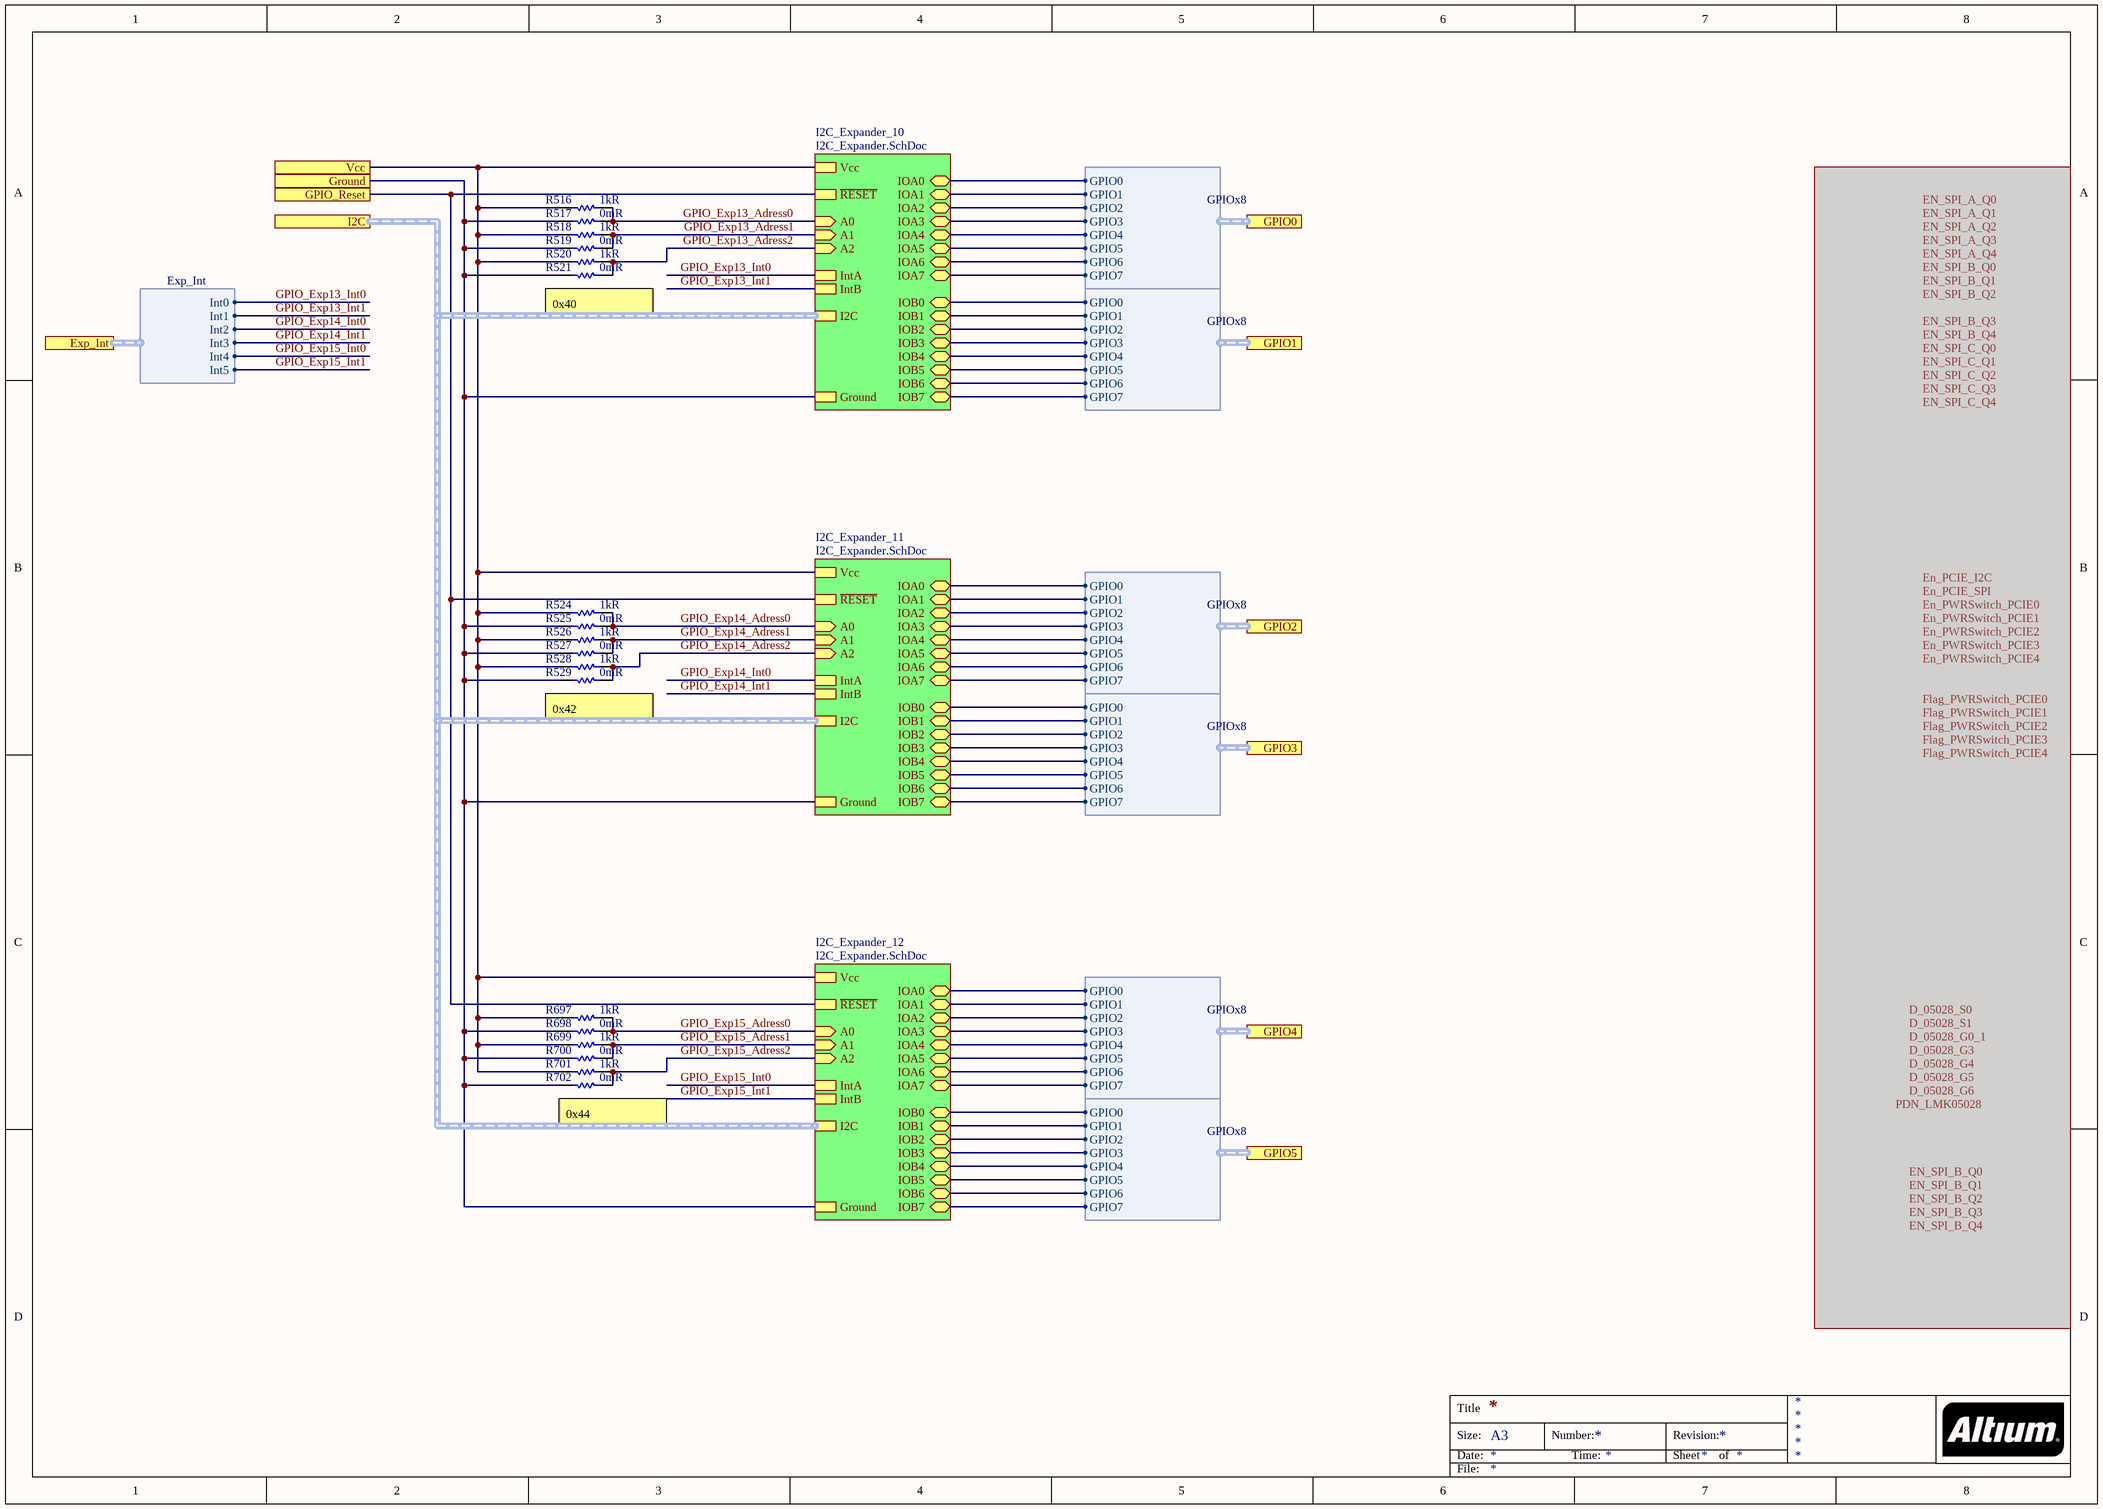
[diagram p49: Ext_GPIO_Bank1.SchDoc]

### Parts
R516  1kR  [RES 0402/1005 RF KK]
R517  0mR  [RES 0402/1005 RF KK]
R518  1kR  [RES 0402/1005 RF KK]
R519  0mR  [RES 0402/1005 RF KK]
R520  1kR  [RES 0402/1005 RF KK]
R521  0mR  [RES 0402/1005 RF KK]
R524  1kR  [RES 0402/1005 RF KK]
R525  0mR  [RES 0402/1005 RF KK]
R526  1kR  [RES 0402/1005 RF KK]
R527  0mR  [RES 0402/1005 RF KK]
R528  1kR  [RES 0402/1005 RF KK]
R529  0mR  [RES 0402/1005 RF KK]
R697  1kR  [RES 0402/1005 RF KK]
R698  0mR  [RES 0402/1005 RF KK]
R699  1kR  [RES 0402/1005 RF KK]
R700  0mR  [RES 0402/1005 RF KK]
R701  1kR  [RES 0402/1005 RF KK]
R702  0mR  [RES 0402/1005 RF KK]

### Sub-sheets
I2C_Expander_10 = I2C_Expander.SchDoc: IOA7 (bidir), IOA3 (bidir), IOA6 (bidir), IOA1 (bidir), IOA0 (bidir), IOA5 (bidir), IOB1 (bidir), IOB2 (bidir), IOB5 (bidir), IOB6 (bidir), IOB7 (bidir), IntA, IntB, Ground, IOB4 (bidir), IOB3 (bidir), IOA2 (bidir), IOA4 (bidir), IOB0 (bidir), Vcc, ~{RESET}, I2C (harness I2C), A2 (in), A1 (in), A0 (in)
I2C_Expander_11 = I2C_Expander.SchDoc: IOA7 (bidir), IOA3 (bidir), IOA6 (bidir), IOA1 (bidir), IOA0 (bidir), IOA5 (bidir), IOB1 (bidir), IOB2 (bidir), IOB5 (bidir), IOB6 (bidir), IOB7 (bidir), IntA, IntB, Ground, IOB4 (bidir), IOB3 (bidir), IOA2 (bidir), IOA4 (bidir), IOB0 (bidir), Vcc, ~{RESET}, I2C (harness I2C), A2 (in), A1 (in), A0 (in)
I2C_Expander_12 = I2C_Expander.SchDoc: IOA7 (bidir), IOA3 (bidir), IOA6 (bidir), IOA1 (bidir), IOA0 (bidir), IOA5 (bidir), IOB1 (bidir), IOB2 (bidir), IOB5 (bidir), IOB6 (bidir), IOB7 (bidir), IntA, IntB, Ground, IOB4 (bidir), IOB3 (bidir), IOA2 (bidir), IOA4 (bidir), IOB0 (bidir), Vcc, ~{RESET}, I2C (harness I2C), A2 (in), A1 (in), A0 (in)

### Ports
Exp_Int (harness Exp_Int), GPIO0 (harness GPIOx8), GPIO1 (harness GPIOx8), GPIO2 (harness GPIOx8), GPIO3 (harness GPIOx8), GPIO4 (harness GPIOx8), GPIO5 (harness GPIOx8), GPIO_Reset, Ground, I2C (harness I2C), Vcc

### Harnesses
GPIOx8: GPIO0, GPIO1, GPIO2, GPIO3, GPIO4, GPIO5, GPIO6, GPIO7
Exp_Int: Int0, Int1, Int2, Int3, Int4, Int5

### Nets
B503_Ground: R517.2 R519.2 R521.2 R525.2 R527.2 R529.2 R698.2 R700.2 R702.2 ; port Ground, sheet I2C_Expander_10/Ground, sheet I2C_Expander_11/Ground, sheet I2C_Expander_12/Ground
3V3_RAIL: R516.1 R518.1 R520.1 R524.1 R526.1 R528.1 R697.1 R699.1 R701.1 ; port Vcc, sheet I2C_Expander_10/Vcc, sheet I2C_Expander_11/Vcc, sheet I2C_Expander_12/Vcc
Charge_CAP: sheet I2C_Expander_11/IOB7, port GPIO3.GPIO7
D_05028_G3: sheet I2C_Expander_12/IOB0, port GPIO5.GPIO0
D_05028_G5: sheet I2C_Expander_12/IOA5, port GPIO4.GPIO5
D_05028_G6: sheet I2C_Expander_12/IOA4, port GPIO4.GPIO4
D_05028_S0: sheet I2C_Expander_12/IOA7, port GPIO4.GPIO7
D_05028_S1: sheet I2C_Expander_12/IOA6, port GPIO4.GPIO6
EN_Detect: sheet I2C_Expander_12/IOB6, port GPIO5.GPIO6
En_PWRSwitch_PCIE0: sheet I2C_Expander_10/IOB2, port GPIO1.GPIO2
En_PWRSwitch_PCIE1: sheet I2C_Expander_11/IOA2, port GPIO2.GPIO2
En_PWRSwitch_PCIE2: sheet I2C_Expander_10/IOA0, port GPIO0.GPIO0
EN_SPI_Q0_MAIN: sheet I2C_Expander_11/IOA3, port GPIO2.GPIO3
EN_SPI_Q1: sheet I2C_Expander_11/IOA0, port GPIO2.GPIO0
EN_SPI_Q1_MAIN: sheet I2C_Expander_11/IOA5, port GPIO2.GPIO5
EN_SPI_Q2: sheet I2C_Expander_10/IOB7, port GPIO1.GPIO7
EN_SPI_Q4: sheet I2C_Expander_11/IOB0, port GPIO3.GPIO0
EN_SPI_Q4_MAIN: sheet I2C_Expander_11/IOB3, port GPIO3.GPIO3
FTDI_JTAG_ON_1: sheet I2C_Expander_12/IOA0, port GPIO4.GPIO0
FTDI_JTAG_ON_2: sheet I2C_Expander_12/IOA1, port GPIO4.GPIO1
FTDI_JTAG_ON_3: sheet I2C_Expander_12/IOA2, port GPIO4.GPIO2
FTDI_JTAG_ON_4: sheet I2C_Expander_12/IOA3, port GPIO4.GPIO3
GPIO_ETH_EXPANDER: sheet I2C_Expander_10/IOB5, port GPIO1.GPIO5
GPIO_Exp13_Adress0: R516.2 R517.1 ; sheet I2C_Expander_10/A0
GPIO_Exp13_Adress1: R518.2 R519.1 ; sheet I2C_Expander_10/A1
GPIO_Exp13_Adress2: R520.2 R521.1 ; sheet I2C_Expander_10/A2
GPIO_Exp13_Int0: sheet I2C_Expander_10/IntA, port Exp_Int.Int0
GPIO_Exp13_Int1: sheet I2C_Expander_10/IntB, port Exp_Int.Int1
GPIO_Exp14_Adress0: R524.2 R525.1 ; sheet I2C_Expander_11/A0
GPIO_Exp14_Adress1: R526.2 R527.1 ; sheet I2C_Expander_11/A1
GPIO_Exp14_Adress2: R528.2 R529.1 ; sheet I2C_Expander_11/A2
GPIO_Exp14_Int0: sheet I2C_Expander_11/IntA, port Exp_Int.Int2
GPIO_Exp14_Int1: sheet I2C_Expander_11/IntB, port Exp_Int.Int3
GPIO_Exp15_Adress0: R697.2 R698.1 ; sheet I2C_Expander_12/A0
GPIO_Exp15_Adress1: R699.2 R700.1 ; sheet I2C_Expander_12/A1
GPIO_Exp15_Adress2: R701.2 R702.1 ; sheet I2C_Expander_12/A2
GPIO_Exp15_Int0: sheet I2C_Expander_12/IntA, port Exp_Int.Int4
GPIO_Exp15_Int1: sheet I2C_Expander_12/IntB, port Exp_Int.Int5
GPIO_Exp_Reset1: port GPIO_Reset, sheet I2C_Expander_10/~{RESET}, sheet I2C_Expander_11/~{RESET}, sheet I2C_Expander_12/~{RESET}
GPIOa_10.GPIO1: sheet I2C_Expander_10/IOA1, port GPIO0.GPIO1
GPIOa_10.GPIO2: sheet I2C_Expander_10/IOA2, port GPIO0.GPIO2
GPIOa_10.GPIO3: sheet I2C_Expander_10/IOA3, port GPIO0.GPIO3
GPIOa_10.GPIO4: sheet I2C_Expander_10/IOA4, port GPIO0.GPIO4
GPIOa_10.GPIO5: sheet I2C_Expander_10/IOA5, port GPIO0.GPIO5
GPIOa_10.GPIO6: sheet I2C_Expander_10/IOA6, port GPIO0.GPIO6
GPIOa_10.GPIO7: sheet I2C_Expander_10/IOA7, port GPIO0.GPIO7
GPIOa_11.GPIO1: sheet I2C_Expander_11/IOA1, port GPIO2.GPIO1
GPIOa_11.GPIO4: sheet I2C_Expander_11/IOA4, port GPIO2.GPIO4
GPIOa_11.GPIO6: sheet I2C_Expander_11/IOA6, port GPIO2.GPIO6
GPIOa_11.GPIO7: sheet I2C_Expander_11/IOA7, port GPIO2.GPIO7
GPIOb_10.GPIO0: sheet I2C_Expander_10/IOB0, port GPIO1.GPIO0
GPIOb_10.GPIO1: sheet I2C_Expander_10/IOB1, port GPIO1.GPIO1
GPIOb_10.GPIO3: sheet I2C_Expander_10/IOB3, port GPIO1.GPIO3
GPIOb_10.GPIO4: sheet I2C_Expander_10/IOB4, port GPIO1.GPIO4
GPIOb_10.GPIO6: sheet I2C_Expander_10/IOB6, port GPIO1.GPIO6
GPIOb_11.GPIO1: sheet I2C_Expander_11/IOB1, port GPIO3.GPIO1
GPIOb_11.GPIO2: sheet I2C_Expander_11/IOB2, port GPIO3.GPIO2
GPIOb_11.GPIO4: sheet I2C_Expander_11/IOB4, port GPIO3.GPIO4
GPIOb_11.GPIO5: sheet I2C_Expander_11/IOB5, port GPIO3.GPIO5
GPIOb_11.GPIO6: sheet I2C_Expander_11/IOB6, port GPIO3.GPIO6
GPIOb_12.GPIO1: sheet I2C_Expander_12/IOB1, port GPIO5.GPIO1
GPIOb_12.GPIO2: sheet I2C_Expander_12/IOB2, port GPIO5.GPIO2
GPIOb_12.GPIO3: sheet I2C_Expander_12/IOB3, port GPIO5.GPIO3
GPIOb_12.GPIO4: sheet I2C_Expander_12/IOB4, port GPIO5.GPIO4
GPIOb_12.GPIO5: sheet I2C_Expander_12/IOB5, port GPIO5.GPIO5
GPIOb_12.GPIO7: sheet I2C_Expander_12/IOB7, port GPIO5.GPIO7

### Buses and harness runs
harness port I2C = sheet I2C_Expander_10/I2C = sheet I2C_Expander_11/I2C = sheet I2C_Expander_12/I2C

### Notes on the sheet
- (near R521) 0x40
- (near R529) 0x42
- (near R702) 0x44
- Title
- Size:
- Date:
- A3
- Number:
- Time:
- Revision:
- Sheet
- of
- File:

### Library data of the parts
R516 R518 R520 R524 R526 R528 R697 R699 R701 = Resistor: as R492 on sheet Ext_GPIO_Bank0; Supplier 1: Digi-Key; Supplier Part Number 1: P1.00KLDKR-ND; Manufacturer: Panasonic; Manufacturer Part Number: ERJ-2RKF1001X; RoHS: Yes; Category: Chip SMD Resistors; Stock 1: 1864188; Pricing 1: 1=0,10000, 10=0,04300, 100=0,01740, 1000=0,00782, 2500=0,00678, 5000=0,00561 (USD); Mount: Surface Mount; Case/Package: 0402; Number of Pins: 2; Contact Plating: Tin; Case Code (Imperial): 0402; Case Code (Metric): 1005; Min Operating Temperature: -55°C; Max Operating Temperature: 155°C; Composition: Thick Film; Resistance: 1kR; Termination: SMD/SMT; Number of Terminations: 2; Military Standard: Not; Features: Automotive AEC-Q200; Packaging: Tape and Reel; Voltage Rating: 50V; Package Quantity: 1; Max Power Dissipation: 100mW; Working Voltage: 50V; Length: 1mm; Height: 0.35mm; Depth: 0.5mm; Width: 0.5mm; Radiation Hardening: No; Lead Free: Lead Free; REACH SVHC: No SVHC; ComponentLink1URL: https://datasheet.ciiva.com/11821/0900766b80f80784-11821203.pdf?src-supplier=RSComponents; ComponentLink1Description: https://datasheet.ciiva.com/11821/0900766b80f80784-11821203.pdf?src-supplier=RSComponents; ComponentLink2URL: https://datasheet.ciiva.com/7942/aoa0000ce2-7942426.pdf?src-supplier=Element14; ComponentLink2Description: https://datasheet.ciiva.com/7942/aoa0000ce2-7942426.pdf?src-supplier=Element14; ComponentLink3URL: https://datasheet.ciiva.com/16523/aoa0000ce2-16523834.pdf?src-supplier=Avnet+Asia; ComponentLink3Description: https://datasheet.ciiva.com/16523/aoa0000ce2-16523834.pdf?src-supplier=Avnet+Asia; ComponentLink4URL: https://datasheet.ciiva.com/17215/aoa0000ce2-17215308.pdf?src-supplier=Avnet+Europe; ComponentLink4Description: https://datasheet.ciiva.com/17215/aoa0000ce2-17215308.pdf?src-supplier=Avnet+Europe; ComponentLink5URL: https://datasheet.ciiva.com/22673/1678782-22673916.pdf?src-supplier=Element14; ComponentLink5Description: https://datasheet.ciiva.com/22673/1678782-22673916.pdf?src-supplier=Element14; ComponentLink6URL: https://datasheet.ciiva.com/28532/1678782-28532109.pdf?src-supplier=Element14; ComponentLink6Description: https://datasheet.ciiva.com/28532/1678782-28532109.pdf?src-supplier=Element14; ComponentLink7URL: https://datasheet.ciiva.com/16767/70260748-16767559.pdf?src-supplier=Allied+Electronics; ComponentLink7Description: https://datasheet.ciiva.com/16767/70260748-16767559.pdf?src-supplier=Allied+Electronics; ComponentLink8URL: https://datasheet.ciiva.com/9198/aoa0000ce2-9198920.pdf?src-supplier=Avnet; ComponentLink8Description: https://datasheet.ciiva.com/9198/aoa0000ce2-9198920.pdf?src-supplier=Avnet; ComponentLink9URL: https://datasheet.ciiva.com/16771/70260748-16771979.pdf?src-supplier=Allied+Electronics; ComponentLink9Description: https://datasheet.ciiva.com/16771/70260748-16771979.pdf?src-supplier=Allied+Electronics
R517 R519 R521 R525 R527 R529 R698 R700 R702 = Resistor: as R665 on sheet Power_48_20V@3A; Supplier 1: Digi-Key; Supplier Part Number 1: 311-0.0JRCT-ND; Stock 1: 69822252; Pricing 1: 1=0.10000, 10=0.01200, 25=0.00920, 50=0.00680, 100=0.00510, 250=0.00388, 500=0.00308, 1000=0.00227, 5000=0.00163 (USD); RoHS: Yes; Case/Package: 0402; Contact Plating: Tin,Matte; Case Code (Metric): 1005; Case Code (Imperial): 0402; Min Operating Temperature: -55°C; Max Operating Temperature: 155°C; Resistance: 0mR; Packaging: Tape and Reel; Composition: Thick Film; Package Quantity: 1; Number of Terminations: 2; Termination: SMD/SMT; Military Standard: Not; Features: Moisture Resistant; Length: 1mm; Height: 0.016inch; Width: 0.02inch; Depth: 0.5mm; Radiation Hardening: No; REACH SVHC: Unknown; Lead Free: Lead Free; ComponentLink1URL: https://datasheet.ciiva.com/2452/pyu-rc0402-51-rohs-l-6-2452608.pdf?src-supplier=Digi-Key; ComponentLink1Description: https://datasheet.ciiva.com/2452/pyu-rc0402-51-rohs-l-6-2452608.pdf?src-supplier=Digi-Key; ComponentLink2URL: https://datasheet.ciiva.com/11808/0900766b80c66297-11808195.pdf?src-supplier=RSComponents; ComponentLink2Description: https://datasheet.ciiva.com/11808/0900766b80c66297-11808195.pdf?src-supplier=RSComponents; ComponentLink3URL: https://datasheet.ciiva.com/2452/pyu-r-int-thick-7-2452609.pdf?src-supplier=Digi-Key; ComponentLink3Description: https://datasheet.ciiva.com/2452/pyu-r-int-thick-7-2452609.pdf?src-supplier=Digi-Key; ComponentLink4URL: https://datasheet.ciiva.com/22747/1018594-22747515.pdf?src-supplier=Element14; ComponentLink4Description: https://datasheet.ciiva.com/22747/1018594-22747515.pdf?src-supplier=Element14; ComponentLink5URL: https://datasheet.ciiva.com/7983/1018594-7983535.pdf?src-supplier=Element14; ComponentLink5Description: https://datasheet.ciiva.com/7983/1018594-7983535.pdf?src-supplier=Element14; ComponentLink6URL: https://datasheet.ciiva.com/2452/pyu-r-int-thick-7-2452610.pdf?src-supplier=Digi-Key; ComponentLink6Description: https://datasheet.ciiva.com/2452/pyu-r-int-thick-7-2452610.pdf?src-supplier=Digi-Key; ComponentLink7URL: https://datasheet.ciiva.com/8896/pyu-rc0402-51-rohs-l-6-8896201.pdf?src-supplier=Avnet; ComponentLink7Description: https://datasheet.ciiva.com/8896/pyu-rc0402-51-rohs-l-6-8896201.pdf?src-supplier=Avnet; ComponentLink8URL: https://datasheet.ciiva.com/28386/pyu-rc0402-51-rohs-l-6-28386633.pdf?src-supplier=Avnet+Europe; ComponentLink8Description: https://datasheet.ciiva.com/28386/pyu-rc0402-51-rohs-l-6-28386633.pdf?src-supplier=Avnet+Europe; ComponentLink9URL: https://datasheet.ciiva.com/15189/getdatasheetpartid-326379-15189533.pdf?src-supplier=Verical; ComponentLink9Description: https://datasheet.ciiva.com/15189/getdatasheetpartid-326379-15189533.pdf?src-supplier=Verical